# Altium schematic sheet 53_BUCK_3V3.SchDoc
size A4; SheetNumber: 13; SheetTotal: 16
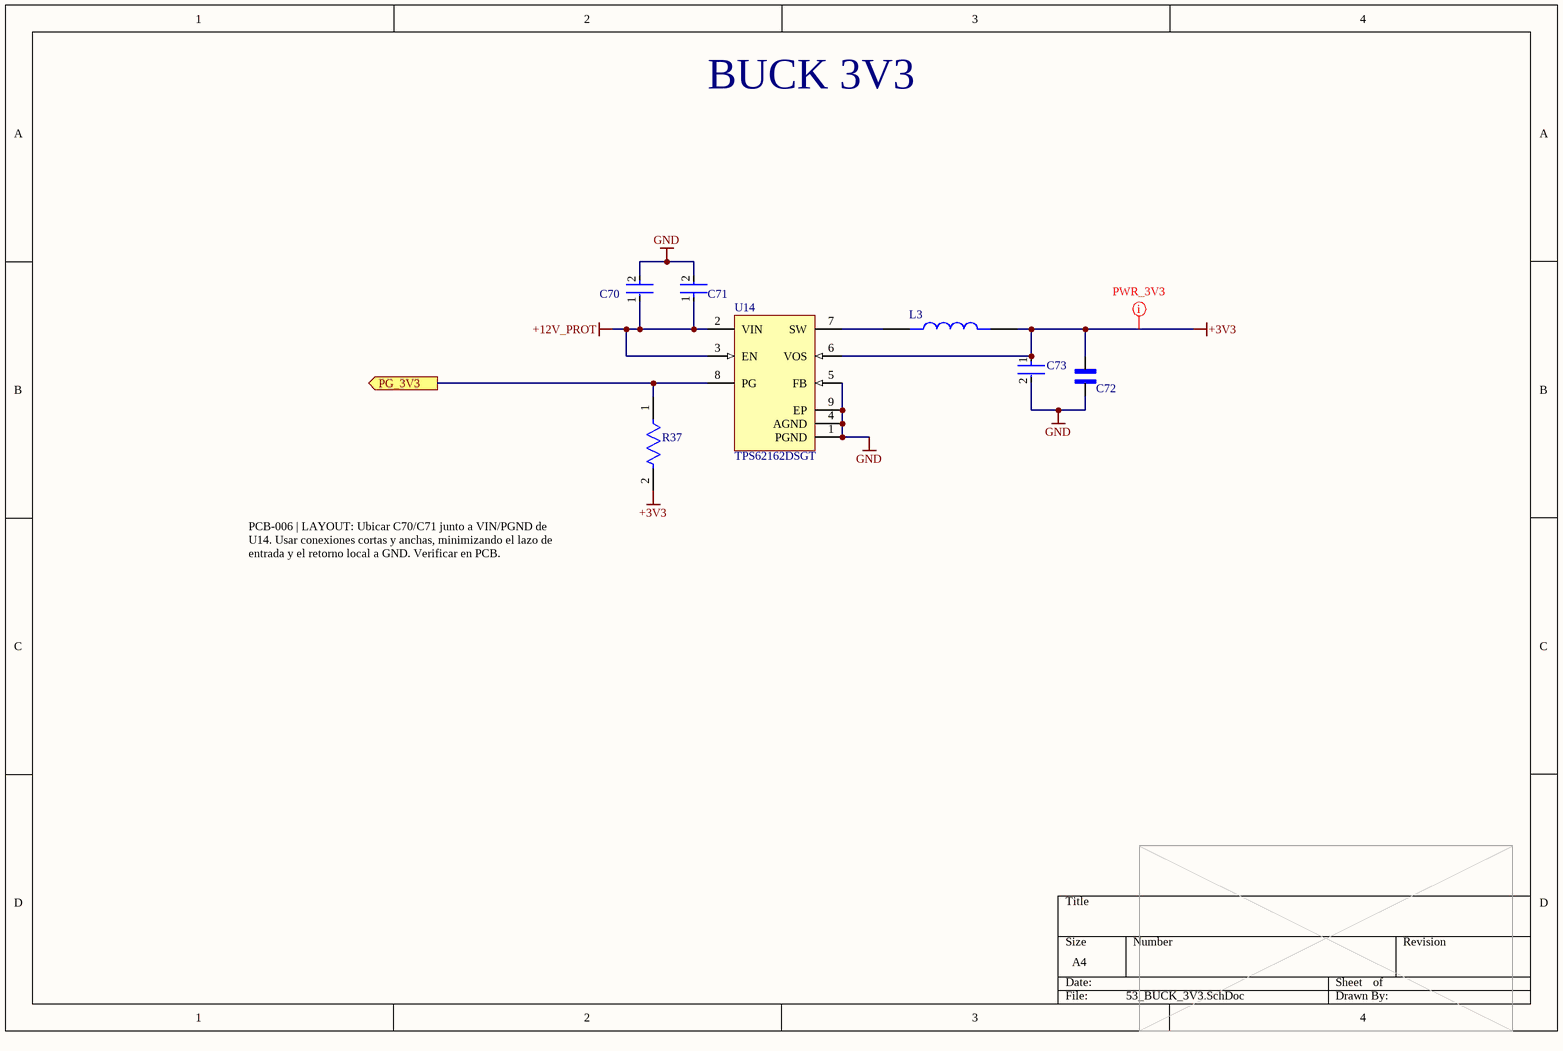
[diagram p0: 53_BUCK_3V3.SchDoc]

## Parts
C70  GCM32ER71E106KA57K  [FP-GCM32E-0_3-IPC_B]  (value not drawn)
C71  C0603C104K3RACTU  [FP-C0603C-CF-IPC_B]  (value not drawn)
C72  C1210C226K8RACAUTO  [CAPC3225X280N]  (value not drawn)
C73  C0603C104K3RACTU  [FP-C0603C-CF-IPC_B]  (value not drawn)
L3  VLS3012HBX-2R2M-N  [IND_VLS3012HBX-2R2M-N]  (value not drawn)
R37  RC0603FR-07100KL  [FP-RC0603-0_55-MFG]  (value not drawn)
U14  TPS62162DSGT  [DSG0008A_V]

## Ports
PG_3V3 (out)

## Nets
+3V3: C72.2 C73.1 L3.2 R37.2 U14.6(VOS)
+12V_PROT: C70.1 C71.1 U14.2(VIN) U14.3(EN)
GND: C70.2 C71.2 C72.1 C73.2 U14.1(PGND) U14.4(AGND) U14.5(FB) U14.9(EP)
PG_3V3: R37.1 U14.8(PG) ; port PG_3V3
NetL3_1: L3.1 U14.7(SW)

## Layout directives
net class PWR_3V3: +3V3

## Notes on the sheet
- BUCK 3V3
- PCB-006 | LAYOUT: Ubicar C70/C71 junto a VIN/PGND de U14. Usar conexiones cortas y anchas, minimizando el lazo de entrada y el retorno local a GND. Verificar en PCB.

## Library data of the parts
C70 = CMP-2000-06320-2: Ceramic Capacitor for Automotive 10uF ±10% 25VDC X7R 1210 Embossed T/R; Voltage Rating (DC): 25V; Height: 2.5mm; Ratings: AEC-Q200; Termination: SMD/SMT; Case Code (Imperial): 1210; Packaging: Tape and Reel; Min Operating Temperature: -55°C; Radiation Hardening: No; Mount: Surface Mount; Depth: 2.5mm; Case Code (Metric): 3225; Length: 3.2mm; Tolerance: 10%; Package Quantity: 4000; Width: 0.098inch; Max Operating Temperature: 125°C; Thickness: 0.106inch; Case/Package: 1210; Capacitance: 10uF; Voltage Rating: 25V; Dielectric: X7R
C71 C73 = CMP-2006-03057-2: CAP CER 0.1UF 25V X7R 0603; Manufacturer: KEMET; Value: 0.10 μF; Material: Ceramic; Tolerance: 0.1; Temperature Coefficient: 30ppm/°C; Automotive Grade: Grade 1; Lead Free: Yes; Device Class L3: Ceramic Capacitors; Voltage Rating: 25 V; Manufacturer Part Number: C0603C104K3RACTU; Digikey Description: CAP CER 0.1UF 25V X7R 0603; Mouser Description: Multilayer Ceramic Capacitors MLCC - SMD/SMT 25volts 0.1uF X7R 10%; Package: C0603C-CF; Temperature Range Low: -55°C; Automotive: Yes; Device Class L2: Capacitors; Octopart: https://octopart.com/c0603c104k3ractu-kemet-127541; ComponentLink2Description: Datasheet; ComponentLink2URL: https://api.kemet.com/component-edge/download/datasheet/C0603C100J5GACAUTO.pdf; Temperature Range High: +125°C; RoHS: TRUE; Device Class L1: Passive Components; Category: Cap; Temperature: -55°C to +125°C; Capacitance: 0.10 μF; Height: 0.87mm; Temperature Characteristic: X7R
C72 = C1210C226K8RACAUTO: 22 ÂµF Â±10% 10V Ceramic Capacitor X7R 1210 (3225 Metric); MF: KEMET; SnapEDA_Link: https://www.snapeda.com/parts/C1210C226K8RACAUTO/Kemet/view-part/?ref=snap; Package: 1210-2 KEMET; Value: *; MP: C1210C226K8RACAUTO; Check_prices: https://www.snapeda.com/parts/C1210C226K8RACAUTO/Kemet/view-part/?ref=eda
L3 = VLS3012HBX-2R2M-N: INDUCTORS FOR POWER CIRCUITS, WO; MF: TDK Corporation; Package: None; Purchase-URL: https://pricing.snapeda.com/search/part/VLS3012HBX-2R2M-N/?ref=eda; Value: *; Availability: In Stock; SnapEDA_Link: https://www.snapeda.com/parts/VLS3012HBX-2R2M-N/TDK/view-part/?ref=snap; MP: VLS3012HBX-2R2M-N; Price: None; Check_prices: https://www.snapeda.com/parts/VLS3012HBX-2R2M-N/TDK/view-part/?ref=eda
R37 = CMP-2100-03662-2: RES SMD 100K OHM 1% 1/10W 0603; Voltage Rating (DC): 50V; Resistance: 100kR; Max Power Dissipation: 100mW; Temperature Coefficient: 100ppm/°C; Working Voltage: 75V; Length: 1.6mm; Lead Free: Lead Free; Number of Terminations: 2; Packaging: Tape and Reel; Voltage Rating: 50V; Termination: SMD/SMT; Width: 0.8mm; Resistor Type: Thick Film; Resistance Tolerance: 1%; Features: Moisture Resistant; Height: 0.45mm; Construction: Rectangular; Case/Package: 0603; Military Standard: Not; Case Code (Imperial): 0603; Series: RC; Technology: THICK FILM; Depth: 0.8mm; RoHS Compliant: Yes; REACH SVHC: No SVHC; Min Operating Temperature: -55°C; Case Code (Metric): 1608; Max Operating Temperature: 155°C; Power Rating: 100mW; Number of Pins: 2; Tolerance: 1%
U14 = CMP-0323-00319-3: Buck Step Down Regulator with 3 to 17 V Input and 3.3 V Output, -40 to 85 degC, 8-Pin WSON (DSG), Green (RoHS & no Sb/Br); Manufacturer: Texas Instruments; Synchronous Rectification: TRUE; Iq(Typ)(mA): 0.017; Switch Current Limit(Typ)(A): 1.8; Regulated Outputs(#): 1; Duty Cycle(Max)(%): 100; SubFamily: Step-Down Regulator; Preset Vout(V): 3.3; Rating: Catalog; Vin(Max)(V): 17; Vin(Min)(V): 3; ComponentLink2Description: Package Specification; PackageVersion: revB, Oct-2010; DatasheetVersion: SLVSAM2A; ComponentLink1Description: Datasheet; PackageDescription: 8-Pin Plastic Small Outline No-Lead, 2 x 2 x 0.8 mm Body, 0.5 mm Pitch, Exposed Pad; ComponentLink2URL: http://www.ti.com/litv/pdf/mpds308a; Code_JEDEC: MO-229; PartNumber: TPS62162DSGT; ComponentLink3URL: Samples URL:http://www.ti.com/product/tps54611#samples; Mounting Technology: Surface Mount; Eco-Plan: Green (RoHS & no Sb/Br); Vout(Min)(V): 3.3; PackageReference: DSG0008A; Topology: Buck; ComponentLink1URL: http://www.ti.com/general/docs/lit/getliterature.tsp?genericPartNumber=TPS62162&fileType=pdf; Vout(Max)(V): 3.3; Iout(Max)(A): 1; ComponentLink3Description: URL Link1